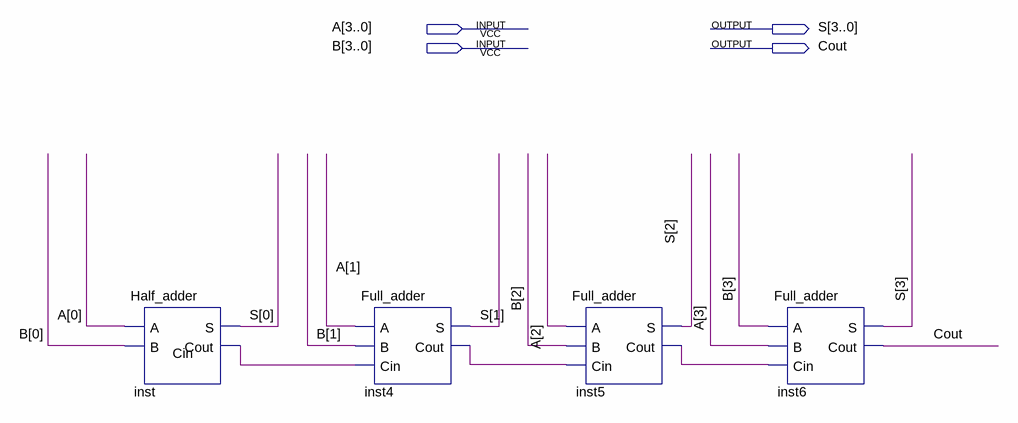
[diagram p0: schematic sheet]
// Quartus schematic Somador_RCA.bdf as structural Verilog: 4 symbols, 4 pins
module Somador_RCA (
  input  [3:0] A,
  input  [3:0] B,
  output [3:0] S,
  output Cout
);

  wire Cin, inst4_cout, inst5_cout;

  Half_adder inst (.A(A[0]), .B(B[0]), .S(S[0]), .Cout(Cin));
  Full_adder inst4 (.A(A[1]), .B(B[1]), .Cin(Cin), .S(S[1]), .Cout(inst4_cout));
  Full_adder inst5 (.A(A[2]), .B(B[2]), .Cin(inst4_cout), .S(S[2]), .Cout(inst5_cout));
  Full_adder inst6 (.A(B[3]), .B(A[3]), .Cin(inst5_cout), .S(S[3]), .Cout(Cout));
endmodule
